# EAGLE design reflow-oven-controller (EAGLE 6.5.0)
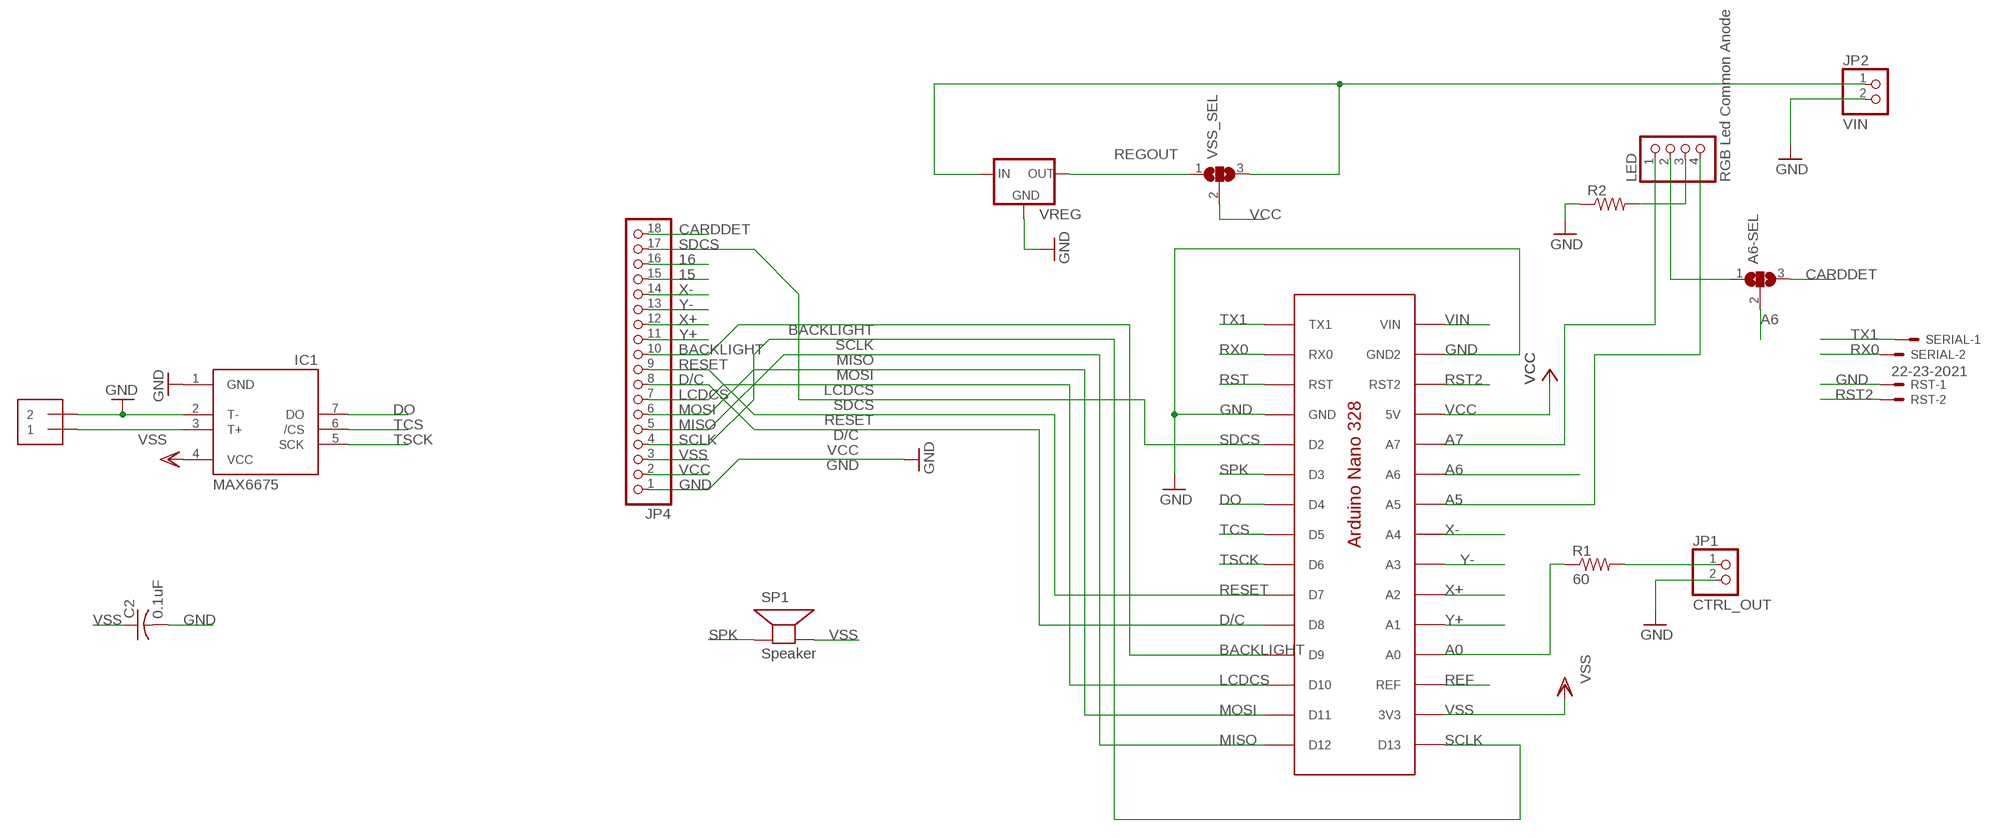
[diagram p0: schematic, sheet 1]

## Parts
A6-SEL  SJ2W  [SJ_2]
C2  0.1uF  C-USC0805K  [C0805K]
IC1  MAX6675  [SO08]
JP1  CTRL_OUT  PINHD-1X2/90  [1X02/90]
JP2  VIN  PINHD-1X2/90  [1X02/90]
JP4  PINHD-1X18  [1X18]
LED  RGB Led Common Anode  PINHD-1X4  [1X04]
R1  60  R-US_M0805  [M0805]
R2  R-US_R0805  [R0805]
RST  22-23-2021  [22-23-2021]
SERIAL  22-23-2021  [22-23-2021]
SP1  Speaker  SPEAKER/PS12  [PS12]
TCOUPLE  1X2-3.5MM  [3.5MMTERM]
U$1  ANANO3.3  [ANANO3.0]
VREG  78MXXS  [78SR]
VSS_SEL  SJ2W  [SJ_2]

## Nets
15: JP4.15
16: JP4.16
A0: R1.1 U$1.A0
A5: LED.4 U$1.A5
A6: A6-SEL.2 U$1.A6
A7: LED.1 U$1.A7
BACKLIGHT: JP4.10 U$1.D9
CARDDET: A6-SEL.3 JP4.18
D/C: JP4.8 U$1.D8
DO: IC1.7(DO) U$1.D4
GND: C2.2 IC1.1(GND) IC1.2(T-) JP1.2 JP2.2 JP4.1 R2.1 RST.1 TCOUPLE.2 U$1.GND U$1.GND2 VREG.GND
LCDCS: JP4.7 U$1.D10
MISO: JP4.5 U$1.D12
MOSI: JP4.6 U$1.D11
N$1: IC1.3(T+) TCOUPLE.1
N$2: A6-SEL.1 LED.2
N$3: JP1.1 R1.2
N$6: LED.3 R2.2
REF: U$1.REF
REGOUT: VREG.OUT VSS_SEL.1
RESET: JP4.9 U$1.D7
RST: U$1.RST
RST2: RST.2 U$1.RST2
RX0: SERIAL.2 U$1.RX0
SCLK: JP4.4 U$1.D13
SDCS: JP4.17 U$1.D2
SPK: SP1.P$1(+) U$1.D3
TCS: IC1.6(/CS) U$1.D5
TRANSIN: JP2.1 VREG.IN VSS_SEL.3
TSCK: IC1.5(SCK) U$1.D6
TX1: SERIAL.1 U$1.TX1
VCC: JP4.2 U$1.5V VSS_SEL.2
VIN: U$1.VIN
VSS: C2.1 IC1.4(VCC) JP4.3 SP1.P$2(-) U$1.3V3
X+: JP4.12 U$1.A2
X-: JP4.14 U$1.A4
Y+: JP4.11 U$1.A1
Y-: JP4.13 U$1.A3

## Library data of the parts
A6-SEL VSS_SEL = jumper:SJ2W: SMD solder JUMPER
C2 = adafruit:C-US: CAPACITOR, American symbol
IC1 = adafruit:MAX6675
JP1 JP2 = pinhead:PINHD-1X2: PIN HEADER
JP4 = adafruit:PINHD-1X18: PIN HEADER
LED = pinhead:PINHD-1X4: PIN HEADER
R1 R2 = resistor:R-US_: RESISTOR, American symbol
RST SERIAL = con-molex:22-23-2021: .100" (2.54mm) Center Header - 2 Pin; MF: MOLEX; MPN: 22-23-2021; OC_FARNELL: 1462926; OC_NEWARK: 25C3832
SP1 = adafruit:SPEAKER: SPEAKER Source: Buerklin Added PS12 (for part # PS1240 piezo) http://www.ladyada.net/library/pcb/eaglelibrary.html
TCOUPLE = adafruit:1X2: 3.5mm Terminal block http://www.ladyada.net/library/pcb/eaglelibrary.html
U$1 = ArduinoNano:ANANO3.3: Arduino Nano 3.0 Pin Specs. http://ca.mouser.com/pdfdocs/Gravitech_Arduino_Nano3_0.pdf http://arduino.cc/en/Main/arduinoBoardNano
VREG = RoboJackets-ICs:78M?S: VOLTAGE REGULATOR

## Board
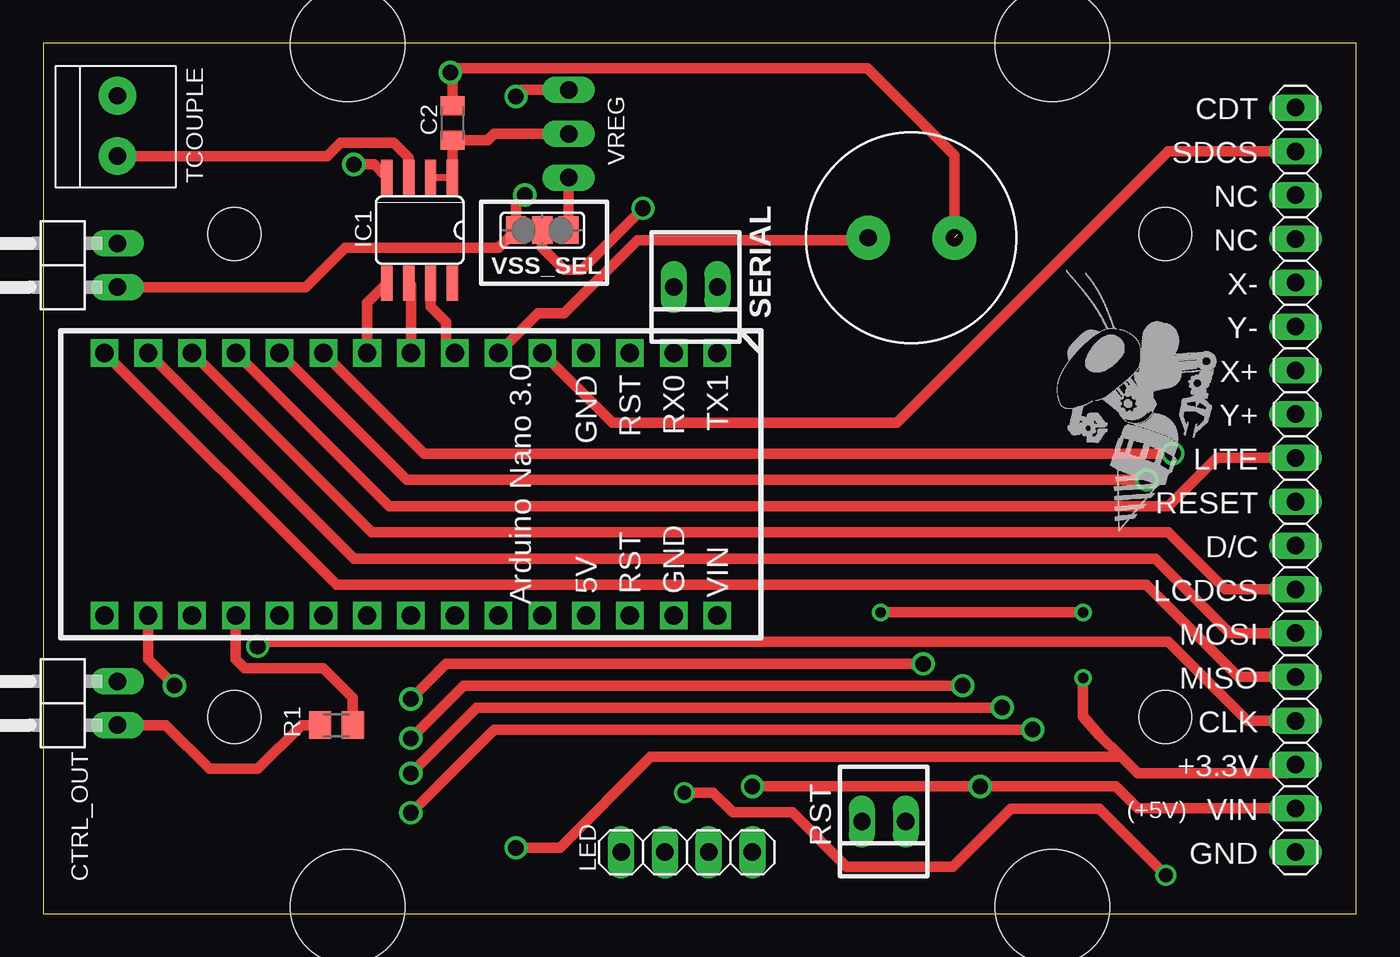
[diagram p1: board, top side]
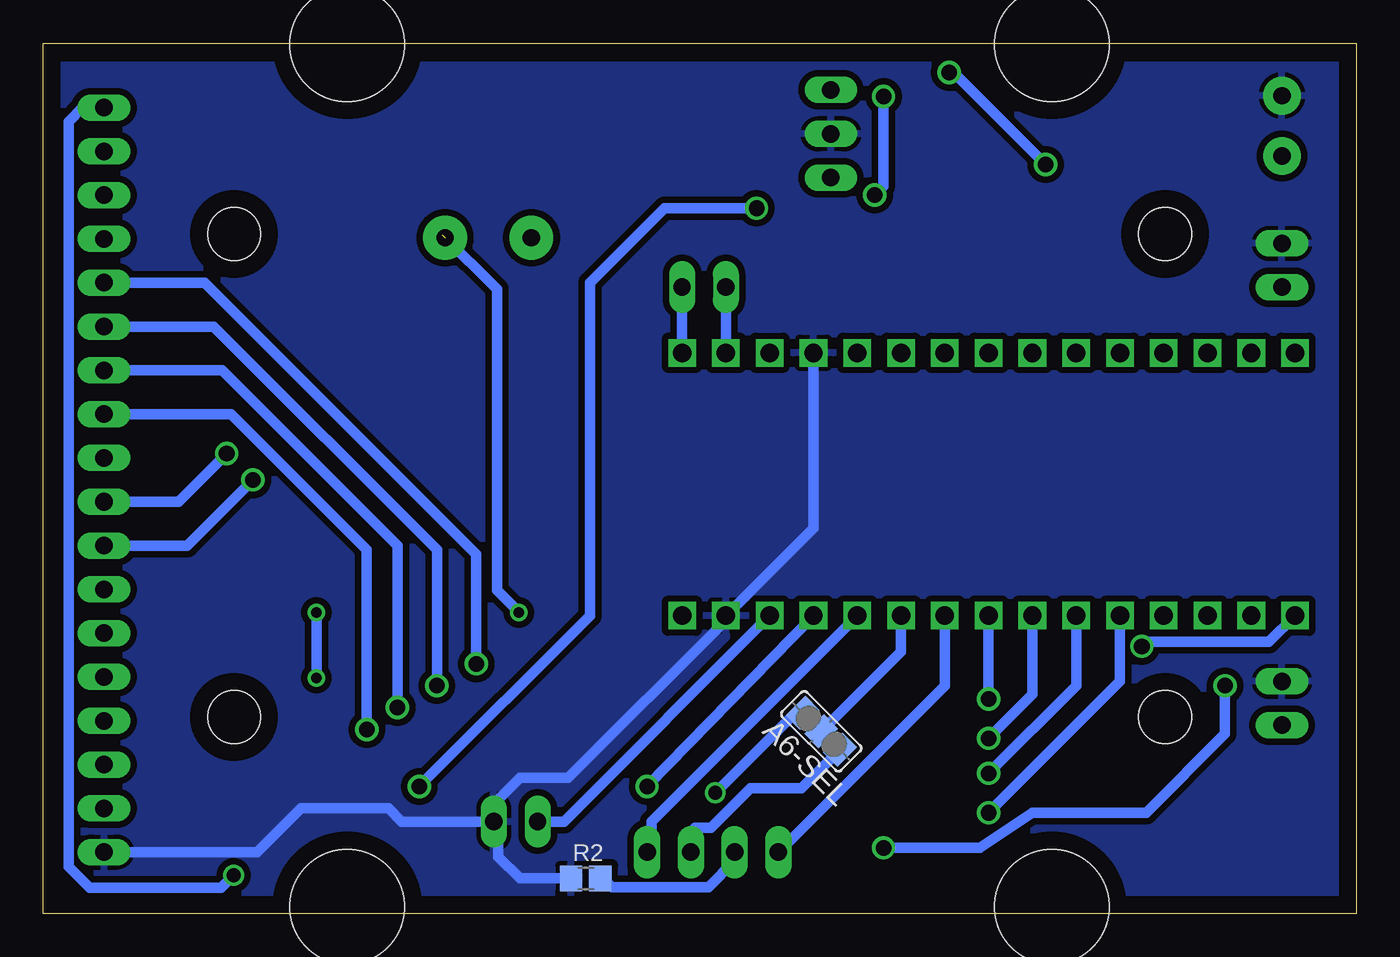
[diagram p2: board, bottom side, seen from below]

Size 76.18 x 50.47 mm. Coordinates in mm from the lower left corner, seen from the top.
Outline: 0,0 76.18,0 76.18,50.47 0,50.47 0,0
Copper layers (1*16): Top 0.035mm / dielectric 1.5mm / Bottom 0.035mm
Design rules "default": minimum track width 10mil, minimum drill 24mil, track to track 8mil, track to pad 8mil, pad to pad 8mil, via to via 8mil, smd to smd 8mil, copper to edge 40mil, drill to drill 8mil, minimum pad ring 10mil, minimum via ring 8mil, stop-mask expansion 4mil, vias tented up to drill 0mil, thermal gap 10mil
Holes 6.63 mm at 17.67,50.4 58.53,0.4 17.67,0.4 58.53,50.4
Holes 3.05 mm at 65.1,39.4 11.1,11.4 65.1,11.4 11.1,39.4
tKeepout: area 13.9,46.6 to 21.5,54.2; area 54.7,46.6 to 62.3,54.2; area 54.7,-3.4 to 62.3,4.2; area 13.9,-3.4 to 21.5,4.2; area 9.5,37.8 to 12.7,41; area 63.5,37.8 to 66.7,41; area 63.5,9.8 to 66.7,13; area 9.5,9.8 to 12.7,13

### Footprints (pad centres in the part's own frame; a part is rotated, then mirrored left to right if it is on the bottom)
SJ_2 = smd 1.168 x 1.6: 1 -1.524,0; 2 0,0; 3 1.524,0
C0805K = smd 1.1 x 1.4: 1 -1,0; 2 1,0
SO08 = smd 0.66 x 2.032: 1 -1.905,-3.073; 2 -0.635,-3.073; 3 0.635,-3.073; 4 1.905,-3.073; 5 1.905,3.073; 6 0.635,3.073; 7 -0.635,3.073; 8 -1.905,3.073
1X02/90 = drill 1.016 long: 1 -1.27,-3.81; 2 1.27,-3.81
1X18 = drill 1.016 long: 1 -21.59,0; 2 -19.05,0; 3 -16.51,0; 4 -13.97,0; 5 -11.43,0; 6 -8.89,0; 7 -6.35,0; 8 -3.81,0; 9 -1.27,0; 10 1.27,0; 11 3.81,0; 12 6.35,0; 13 8.89,0; 14 11.43,0; 15 13.97,0; 16 16.51,0; 17 19.05,0; 18 21.59,0
1X04 = drill 1.016 long: 1 -3.81,0; 2 -1.27,0; 3 1.27,0; 4 3.81,0
M0805 = smd 1.3 x 1.6: 1 -0.95,0; 2 0.95,0
R0805 = smd 1.3 x 1.5: 1 -0.85,0; 2 0.85,0
22-23-2021 = drill 1 long: 1 -1.27,0; 2 1.27,0
PS12 = drill 1 pad 2.54: P$1 -2.5,0; P$2 2.5,0
3.5MMTERM = drill 1 pad 2.184: 1 1.8,0; 2 -1.7,0
ANANO3.0 = drill 1.067 square: 3V3 15.24,-34.29; 5V 15.24,-8.89; A0 15.24,-29.21; A1 15.24,-26.67; A2 15.24,-24.13; A3 15.24,-21.59; A4 15.24,-19.05; A5 15.24,-16.51; A6 15.24,-13.97; A7 15.24,-11.43; D2 0,-11.43; D3 0,-13.97; D4 0,-16.51; D5 0,-19.05; D6 0,-21.59; D7 0,-24.13; D8 0,-26.67; D9 0,-29.21; D10 0,-31.75; D11 0,-34.29; D12 0,-36.83; D13 15.24,-36.83; GND 0,-8.89; GND2 15.24,-3.81; REF 15.24,-31.75; RST 0,-6.35; RST2 15.24,-6.35; RX0 0,-3.81; TX1 0,-1.27; VIN 15.24,-1.27
78SR = drill 1.016 long: GND 0,-2.54; IN -2.54,-2.54; OUT 2.54,-2.54

### Placement (x,y rotation side)
A6-SEL  31.04,10.57 135 bottom
C2  23.75,45.85 270 top
IC1  21.84,39.62 180 top
JP1  0.51,12.19 90 top
JP2  0.51,37.59 90 top
JP4  72.64,25.15 90 top
LED  37.34,3.56 180 top
R1  17.02,10.92 180 top
R2  44.7,2.03 0 bottom
RST  48.77,5.33 180 top
SERIAL  37.85,36.32 180 top
SP1  50.36,39.18 0 top
TCOUPLE  4.32,45.72 270 top
U$1  40.39,32.51 270 top
U$2  [ROBOBUZZ_0.8X]  62.36,22.16 0 top
VREG  33.02,45.21 270 top
VSS_SEL  28.96,39.62 180 top

### Tracks (layer width: path | path; a pad name or v marks a point on that pad's centre or on a via)
A0
  Top 0.61: R1.1 17.97,12.51 16.26,14.22 11.68,14.22 11.18,14.73 U$1.A0
A5
  Bottom 0.61: U$1.A5 23.88,13.21 LED.4
A6
  Bottom 0.61: A6-SEL.2 26.42,15.19 U$1.A6
A7
  Bottom 0.61: LED.1 40.89,3.81 40.89,5.33 U$1.A7
BACKLIGHT
  Top 0.61: U$1.D9 20.07,23.62 65.28,23.62 68.07,26.42 JP4.10
CARDDET  (via drill 0.8)
  Top 0.61: v37.19,7.01 38.86,7.01 40.01,5.87 43.46,5.87 46.61,2.72 52.78,2.72 56.13,6.07 61.27,6.07 v65.13,2.21
  Bottom 0.61: A6-SEL.3 32.55,11.64 v37.19,7.01 | v65.13,2.21 65.84,1.5 73.48,1.5 74.7,2.72 74.7,45.92 73.91,46.71 72.67,46.71 JP4.18
D/C  (via drill 0.9)
  Top 0.61: U$1.D8 21.08,25.15 v64.01,25.15
  Bottom 0.61: v64.01,25.15 67.82,21.34 JP4.8
DO
  Top 0.61: U$1.D4 23.37,33.02 23.37,34.29 22.48,35.18 IC1.7
GND
  Top 0.406: IC1.2 IC1.1
  Top 0.61: IC1.1 C2.2 25.8,44.85 26.16,45.21 VREG.GND
  Bottom 0.61: JP4.1 63.75,3.56 61.21,6.1 56.13,6.1 55.37,5.33 RST.1 49.78,5.59 | 49.78,5.59 49.78,6.6 48.51,7.87 45.72,7.87 36.58,17.02 U$1.GND2 31.5,22.35 U$1.GND | 49.78,5.59 49.78,3.3 48.51,2.03 R2.1
  pour Bottom (isolate 0.381): 1.27,0.64 74.93,0.64 arc90 75.56,1.27 75.56,48.9 arc90 74.93,49.53 1.27,49.53 arc90 0.64,48.9 0.64,1.27 arc90
LCDCS
  Top 0.61: U$1.D10 19.05,22.1 65.28,22.1 68.58,18.8 JP4.7
MISO
  Top 0.61: U$1.D12 17.02,19.05 64.01,19.05 69.34,13.72 JP4.5
MOSI
  Top 0.61: U$1.D11 18.03,20.57 64.52,20.57 68.83,16.26 JP4.6
N$1
  Top 0.61: TCOUPLE.1 16.49,43.92 17.27,44.7 20.32,44.7 21.21,43.81 IC1.3
N$2
  Bottom 0.61: LED.2 38.61,4.72 38.35,4.98 37.44,4.98 35.15,7.26 32.19,7.26 A6-SEL.1
N$3
  Top 0.61: JP1.1 7.11,10.92 9.65,8.38 12.45,8.38 14.99,10.92 R1.2
N$6
  Bottom 0.61: LED.3 36.07,3.05 37.59,1.52 43.18,1.52 43.69,2.03 R2.2
REGOUT
  Top 0.61: VSS_SEL.1 VREG.OUT
RESET  (via drill 0.9)
  Top 0.61: U$1.D7 22.1,26.67 v65.53,26.67
  Bottom 0.61: v65.53,26.67 68.33,23.88 JP4.9
RST2
  Bottom 0.61: U$1.RST2 45.97,5.33 RST.2
RX0
  Bottom 0.61: U$1.RX0 SERIAL.2
SCLK  (via drill 0.9)
  Top 0.61: JP4.4 69.85,11.18 65.28,15.75 12.7,15.75 v12.45,15.49
  Bottom 0.61: U$1.D13 5.08,15.75 12.19,15.75 v12.45,15.49
SDCS
  Top 0.61: U$1.D2 33.02,28.45 49.53,28.45 65.28,44.2 JP4.17
SPK
  Top 0.61: U$1.D3 28.7,34.8 30.23,34.8 34.48,39.05 47.85,39.05 SP1.P$1
TCS
  Top 0.61: U$1.D5 21.34,36.42 IC1.6
TRANSIN  (via drill 0.9)
  Top 0.61: JP2.1 15.24,36.32 17.53,38.61 26.42,38.61 VSS_SEL.3 27.43,41.15 v27.94,41.66 | 29.72,47.75 VREG.IN 27.81,47.75 v27.43,47.37
  Bottom 0.61: v27.43,47.37 27.43,42.16 v27.94,41.66
TSCK
  Top 0.61: U$1.D6 18.8,35.41 IC1.5
TX1
  Bottom 0.61: U$1.TX1 SERIAL.1
VCC  (via drill 0.9)
  Top 0.61: v41.15,7.37 v54.36,7.37 62.23,7.37 63.5,6.1 JP4.2 | VSS_SEL.2 28.96,38.61 30.23,37.34 31.24,37.34 v34.8,40.89
  Bottom 0.61: U$1.5V v41.15,7.37 | v34.8,40.89 40.13,40.89 44.45,36.58 44.45,17.27 v54.36,7.37
VSS  (via drill 0.6, 0.9)  (1 unrouted)
  Top 0.61: U$1.3V3 6.1,14.73 v7.62,13.21 | v27.43,3.81 29.97,3.81 35.24,9.08 62.55,9.08 | 62.55,9.08 63.5,8.13 72.14,8.13 JP4.3 | IC1.4 19.2,43.43 v18.03,43.43 | C2.1 23.75,48.64 v23.62,48.77 23.88,49.02 47.82,49.02 52.85,43.98 SP1.P$2 | v60.33,17.46 v48.58,17.46 | v60.33,13.65 60.33,11.43 61.28,10.35 62.55,9.08
  Bottom 0.61: v7.62,13.21 7.62,10.41 12.19,5.84 18.8,5.84 21.84,3.81 v27.43,3.81 | v18.03,43.43 23.37,48.77 v23.62,48.77 | v48.58,17.46 49.85,18.73 49.85,36.2 53.02,39.37 | v60.33,13.65 v60.33,17.46
X+  (via drill 0.9)
  Top 0.61: v21.34,8.13 25.15,11.94 v55.63,11.94
  Bottom 0.61: U$1.A2 16.26,13.21 v21.34,8.13 | v55.63,11.94 55.63,21.34 65.79,31.5 JP4.12
X-  (via drill 0.9)
  Top 0.61: v21.34,12.45 23.37,14.48 v51.05,14.48
  Bottom 0.61: U$1.A4 v21.34,12.45 | v51.05,14.48 51.05,20.83 66.8,36.58 JP4.14
Y+  (via drill 0.9)
  Top 0.61: v21.34,5.84 26.16,10.67 v57.4,10.67
  Bottom 0.61: U$1.A1 13.72,13.46 v21.34,5.84 | v57.4,10.67 57.4,21.08 65.28,28.96 JP4.11
Y-  (via drill 0.9)
  Top 0.61: v21.34,10.16 24.38,13.21 v53.34,13.21
  Bottom 0.61: U$1.A3 18.8,12.7 v21.34,10.16 | v53.34,13.21 53.34,21.08 66.29,34.04 JP4.13

### Text on the board
tNames: CDT | SDCS | NC | NC | X- | Y- | X+ | Y+ | LITE | RESET | D/C | LCDCS | MOSI | MISO | CLK | +3.3V | (+5V) | VIN | GND